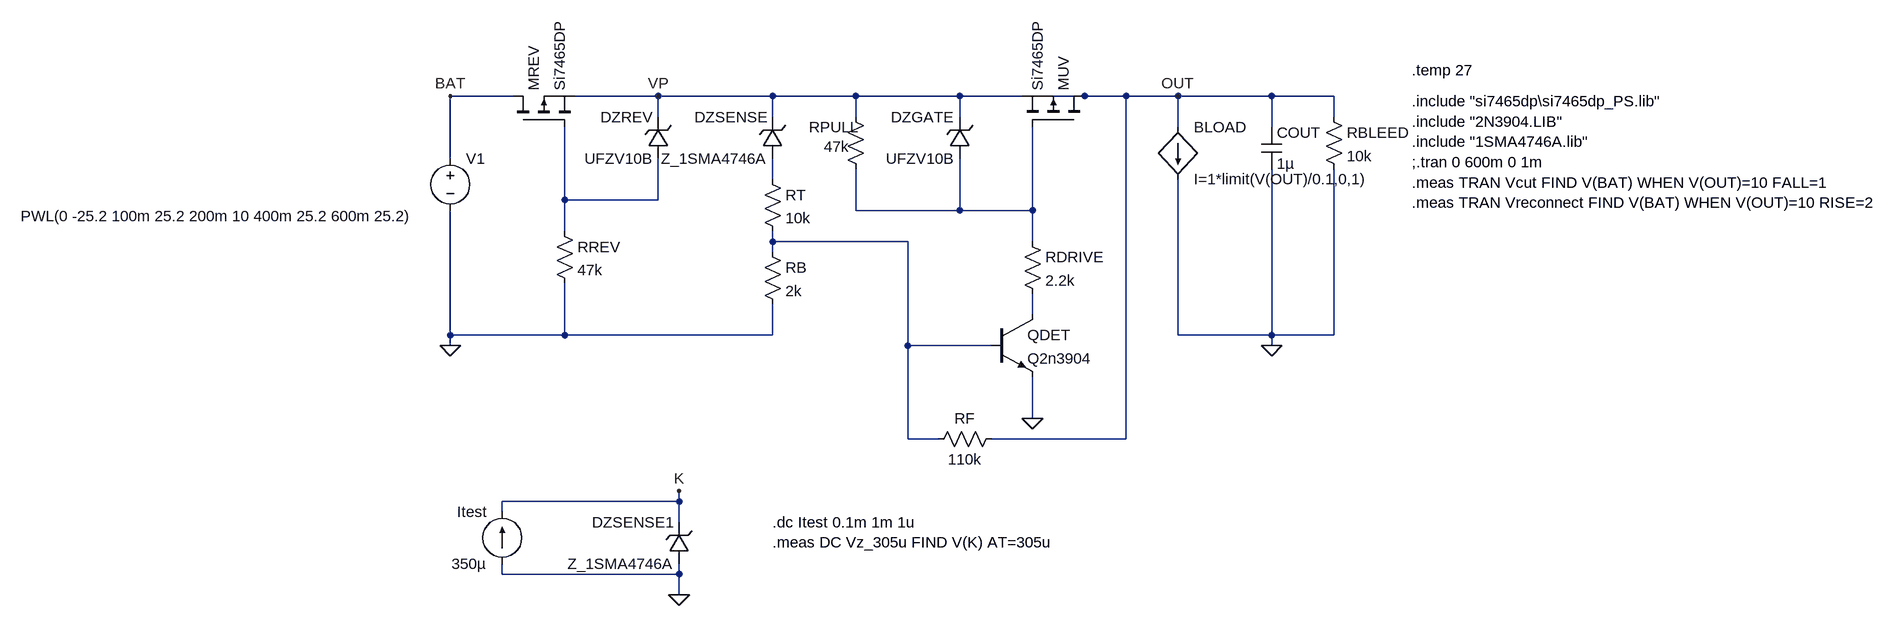
[diagram p0: schematic simulation.asc]
simulation.asc, the LTspice schematic file:
Version 4.1
SHEET 1 2504 836
WIRE 128 16 32 16
WIRE 352 16 224 16
WIRE 528 16 352 16
WIRE 656 16 528 16
WIRE 816 16 656 16
WIRE 912 16 816 16
WIRE 1008 16 944 16
WIRE 1072 16 1008 16
WIRE 1152 16 1072 16
WIRE 1296 16 1152 16
WIRE 1392 16 1296 16
WIRE 352 48 352 16
WIRE 528 48 528 16
WIRE 656 48 656 16
WIRE 816 48 816 16
WIRE 1392 48 1392 16
WIRE 1152 64 1152 16
WIRE 1296 64 1296 16
WIRE 32 112 32 16
WIRE 528 144 528 112
WIRE 208 176 208 64
WIRE 352 176 352 112
WIRE 352 176 208 176
WIRE 656 192 656 128
WIRE 816 192 816 112
WIRE 816 192 656 192
WIRE 928 192 928 64
WIRE 928 192 816 192
WIRE 208 224 208 176
WIRE 528 240 528 224
WIRE 736 240 528 240
WIRE 928 240 928 192
WIRE 528 256 528 240
WIRE 928 352 928 320
WIRE 32 384 32 192
WIRE 208 384 208 304
WIRE 208 384 32 384
WIRE 528 384 528 336
WIRE 528 384 208 384
WIRE 1152 384 1152 144
WIRE 1296 384 1296 128
WIRE 1296 384 1152 384
WIRE 1392 384 1392 128
WIRE 1392 384 1296 384
WIRE 32 400 32 384
WIRE 736 400 736 240
WIRE 864 400 736 400
WIRE 1296 400 1296 384
WIRE 928 512 928 448
WIRE 736 544 736 400
WIRE 784 544 736 544
WIRE 1072 544 1072 16
WIRE 1072 544 864 544
WIRE 384 640 384 624
WIRE 384 640 112 640
WIRE 112 656 112 640
WIRE 384 672 384 640
WIRE 112 752 112 736
WIRE 384 752 384 736
WIRE 384 752 112 752
WIRE 384 784 384 752
FLAG 32 400 0
FLAG 1296 400 0
FLAG 928 512 0
FLAG 32 16 BAT
FLAG 352 16 VP
FLAG 1152 16 OUT
FLAG 384 784 0
FLAG 384 624 K
SYMBOL voltage 32 96 R0
WINDOW 3 -661 105 Left 2
WINDOW 123 0 0 Left 0
WINDOW 39 0 0 Left 0
SYMATTR Value PWL(0 -25.2 100m 25.2 200m 10 400m 25.2 600m 25.2)
SYMATTR InstName V1
SYMBOL pmos 128 64 R270
SYMATTR InstName MREV
SYMATTR Value Si7465DP
SYMATTR Prefix x
SYMBOL res 192 208 R0
SYMATTR InstName RREV
SYMATTR Value 47k
SYMBOL res 512 240 R0
SYMATTR InstName RB
SYMATTR Value 2k
SYMBOL res 512 128 R0
SYMATTR InstName RT
SYMATTR Value 10k
SYMBOL res 640 32 R0
WINDOW 0 -56 32 Left 2
WINDOW 3 -33 62 Left 2
SYMATTR InstName RPULL
SYMATTR Value 47k
SYMBOL res 1376 32 R0
SYMATTR InstName RBLEED
SYMATTR Value 10k
SYMBOL cap 1280 64 R0
SYMATTR InstName COUT
SYMATTR Value 1µ
SYMBOL npn 864 352 R0
SYMATTR InstName QDET
SYMATTR Value Q2n3904
SYMATTR Prefix Q
SYMBOL zener 368 112 R180
WINDOW 0 24 64 Left 2
WINDOW 3 24 0 Left 2
SYMATTR InstName DZREV
SYMATTR Value UFZV10B
SYMBOL zener 544 112 R180
WINDOW 0 24 64 Left 2
WINDOW 3 24 0 Left 2
SYMATTR InstName DZSENSE
SYMATTR Value Z_1SMA4746A
SYMATTR Prefix x
SYMBOL res 880 528 R90
WINDOW 0 0 56 VBottom 2
WINDOW 3 32 56 VTop 2
SYMATTR InstName RF
SYMATTR Value 110k
SYMBOL zener 832 112 R180
WINDOW 0 24 64 Left 2
WINDOW 3 24 0 Left 2
SYMATTR InstName DZGATE
SYMATTR Value UFZV10B
SYMBOL bi 1152 64 R0
SYMATTR InstName BLOAD
SYMATTR Value I=1*limit(V(OUT)/0.1,0,1)
SYMBOL pmos 1008 64 M270
SYMATTR InstName MUV
SYMATTR Value Si7465DP
SYMATTR Prefix x
SYMBOL res 912 224 R0
SYMATTR InstName RDRIVE
SYMATTR Value 2.2k
SYMBOL zener 400 736 R180
WINDOW 0 24 64 Left 2
WINDOW 3 24 0 Left 2
SYMATTR InstName DZSENSE1
SYMATTR Value Z_1SMA4746A
SYMATTR Prefix x
SYMBOL current 112 736 R180
WINDOW 0 24 80 Left 2
WINDOW 3 24 0 Left 2
WINDOW 123 0 0 Left 0
WINDOW 39 0 0 Left 0
SYMATTR InstName Itest
SYMATTR Value 350µ
TEXT 1512 24 Left 2 !.include "si7465dp\\si7465dp_PS.lib"\n.include "2N3904.LIB"\n.include "1SMA4746A.lib"\n;.tran 0 600m 0 1m\n.meas TRAN Vcut FIND V(BAT) WHEN V(OUT)=10 FALL=1\n.meas TRAN Vreconnect FIND V(BAT) WHEN V(OUT)=10 RISE=2
TEXT 528 672 Left 2 !.dc Itest 0.1m 1m 1u\n.meas DC Vz_305u FIND V(K) AT=305u
TEXT 1512 -24 Left 2 !.temp 27

The netlist it stands for:
* simulation.asc
V1 BAT 0 PWL(0 -25.2 100m 25.2 200m 10 400m 25.2 600m 25.2)
X§MREV BAT N002 VP Si7465DP  ; pins D G S
RREV N002 0 47k
RB N004 0 2k
RT N001 N004 10k
RPULL VP N003 47k
RBLEED OUT 0 10k
COUT OUT 0 1µ
QDET N005 N004 0 0 Q2n3904
DZREV N002 VP UFZV10B
X§DZSENSE N001 VP Z_1SMA4746A  ; pins + -
RF OUT N004 110k
DZGATE N003 VP UFZV10B
BLOAD OUT 0 I=1*limit(V(OUT)/0.1,0,1)
X§MUV OUT N003 VP Si7465DP  ; pins D G S
RDRIVE N003 N005 2.2k
X§DZSENSE1 0 K Z_1SMA4746A  ; pins + -
Itest 0 K 350µ
.model D D
.lib standard.dio
.model NPN NPN
.model PNP PNP
.lib standard.bjt
.include "si7465dp\si7465dp_PS.lib"
.include "2N3904.LIB"
.include "1SMA4746A.lib"
;.tran 0 600m 0 1m
.meas TRAN Vcut FIND V(BAT) WHEN V(OUT)=10 FALL=1
.meas TRAN Vreconnect FIND V(BAT) WHEN V(OUT)=10 RISE=2
.dc Itest 0.1m 1m 1u
.meas DC Vz_305u FIND V(K) AT=305u
.temp 27
.backanno
.end